# Altium schematic sheet SIM.SchDoc
size A4; SheetNumber: 4; SheetTotal: 5
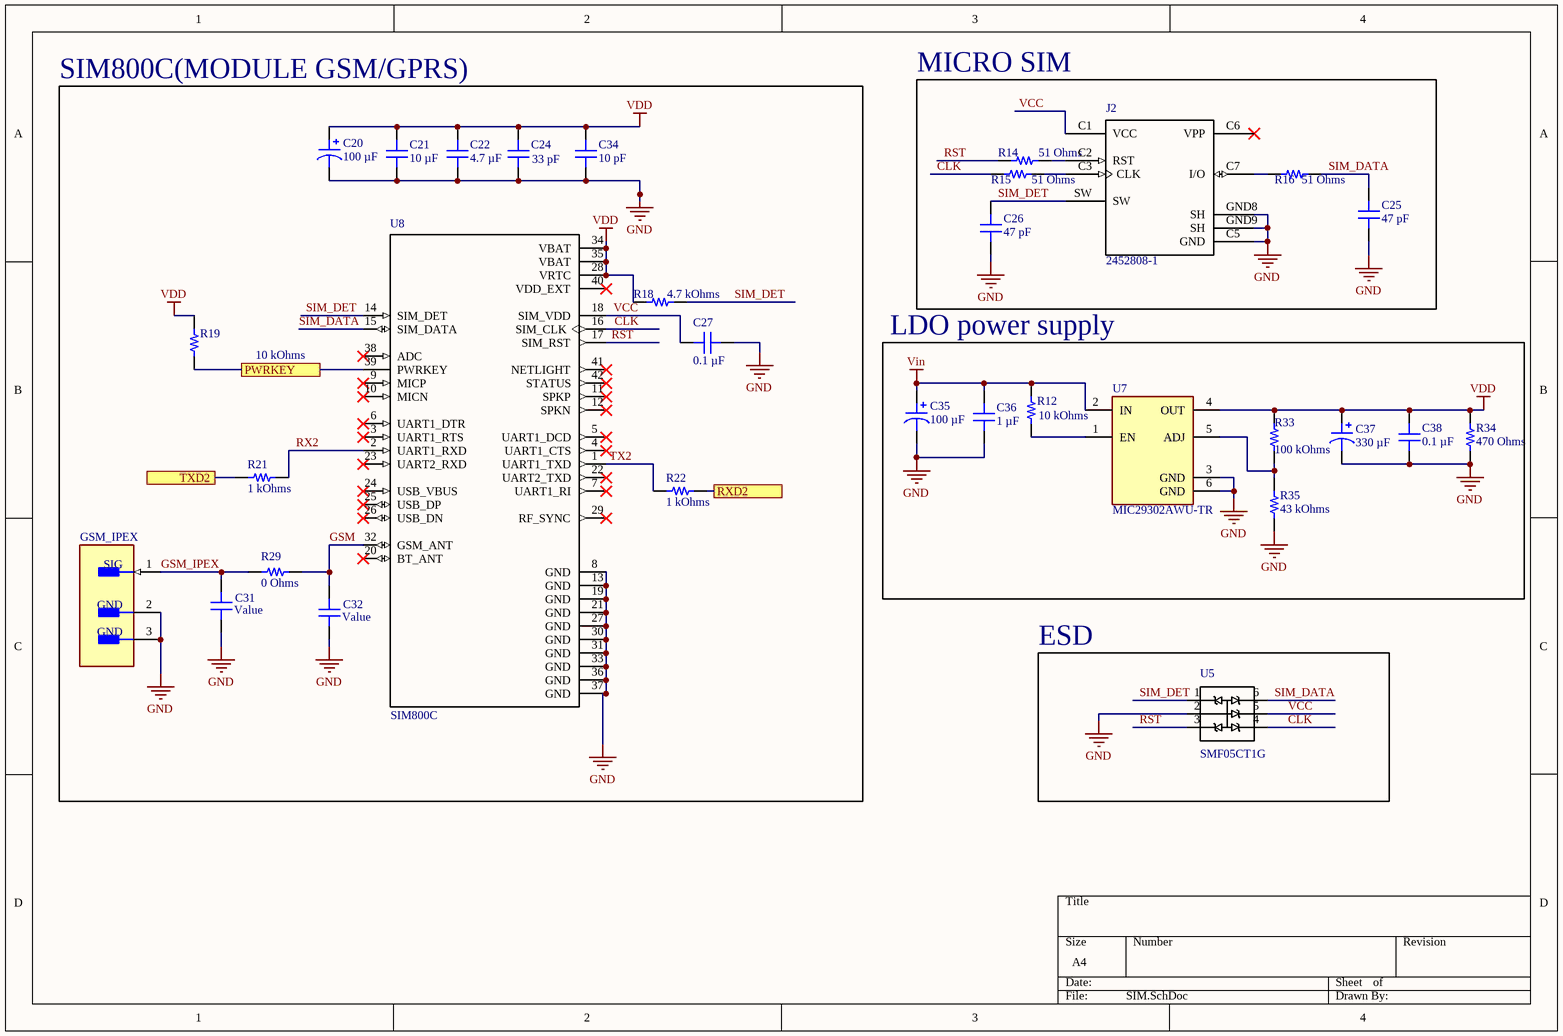
[diagram p0: SIM.SchDoc]

## Parts
C20  100 µF  [CAP POL 1206_3216]
C21  10 µF  [CAP 0805_2012]
C22  4.7 µF  [CAP 0402_1005]
C24  Capacitance: 33 pF  [CAP 0402_1005]  (hidden comment: Value)
C25  47 pF  [CAP 0402_1005]
C26  47 pF  [CAP 0402_1005]
C27  0.1 µF  [CAP 0402_1005]
C31  Value  [CAP 0402_1005]
C32  Value  [CAP 0402_1005]
C34  10 pF  [CAP 0402_1005]
C35  100 µF  [CAP POL 1206_3216]
C36  1 µF  [CAP 0402_1005]
C37  330 µF  [CAP POL 2917_7343]
C38  0.1 µF  [CAP 0402_1005]
GSM_IPEX  U.FL-R-SMT-1(10)  [FP-U_FL-R-SMT-1_10-MFG]  (value not drawn)
J2  2452808-1  [*TE_2452808-1_2452808-1(Primary)]
R12  10 kOhms  [RES 0402_1005]
R14  51 Ohms  [RES 0402_1005]
R15  51 Ohms  [RES 0402_1005]
R16  51 Ohms  [RES 0402_1005]
R18  4.7 kOhms  [RES 0402_1005]
R19  10 kOhms  [RES 0402_1005]
R21  1 kOhms  [RES 0402_1005]
R22  1 kOhms  [RES 0402_1005]
R29  0 Ohms  [RES 0402_1005]
R33  100 kOhms  [RES 0402_1005]
R34  470 Ohms  [RES 0402_1005]
R35  43 kOhms  [RES 0402_1005]
U5  SMF05CT1G  [*SOT65P210X110-6N]
U7  MIC29302AWU-TR  [FP-T0263-5LD-PL-1-MFG]
U8  SIM800C  [SIM800C]

## Blocks framed on the sheet
SIM800C(MODULE GSM/GPRS): C20-C22 C24 C27 C31 C32 C34 GSM_IPEX R18 R19 R21 R22 R29 U8
MICRO SIM: C25 C26 J2 R14-R16
LDO power supply: C35-C38 R12 R33-R35 U7
ESD: U5

## Ports
PWRKEY, RXD2, TXD2

## Nets
GND: C20.2 C21.1 C22.1 C24.1 C25.1 C26.1 C27.1 C31.1 C32.1 C34.1 C35.2 C36.1 C37.2 C38.1 GSM_IPEX.2(GND) GSM_IPEX.3(GND) J2.C5(GND) J2.GND8(SH) J2.GND9(SH) R34.1 R35.1 U5.2(A) U7.3(GND) U7.6(GND) U8.8(GND) U8.13(GND) U8.19(GND) U8.21(GND) U8.27(GND) U8.30(GND) U8.31(GND) U8.33(GND) U8.36(GND) U8.37(GND)
VDD: C20.1 C21.2 C22.2 C24.2 C34.2 C37.1 C38.2 R18.1 R19.2 R33.2 R34.2 U7.4(OUT) U8.28(VRTC) U8.34(VBAT) U8.35(VBAT)
Vin: C35.1 C36.2 R12.2 U7.2(IN)
CLK: R15.1 U5.4(C3) U8.16(SIM_CLK)
GSM: C32.2 R29.2 U8.32(GSM_ANT)
GSM_IPEX: C31.2 GSM_IPEX.1(SIG) R29.1
PWRKEY: R19.1 U8.39(PWRKEY) ; port PWRKEY
RST: R14.1 U5.3(C2) U8.17(SIM_RST)
RX2: R21.1 U8.2(UART1_RXD)
RXD2: R22.1 ; port RXD2
SIM_DATA: C25.2 R16.2 U5.6(C5) U8.15(SIM_DATA)
SIM_DET: C26.2 J2.SW R18.2 U5.1(C1) U8.14(SIM_DET)
TX2: R22.2 U8.1(UART1_TXD)
TXD2: R21.2 ; port TXD2
VCC: C27.2 J2.C1(VCC) U5.5(C4) U8.18(SIM_VDD)
NetJ2_C2: J2.C2(RST) R14.2
NetJ2_C3: J2.C3(CLK) R15.2
NetJ2_C7: J2.C7(I/O) R16.1
NetR12_1: R12.1 U7.1(EN)
NetR33_1: R33.1 R35.2 U7.5(ADJ)

Not connected (* = marked no-connect by the designer): J2 C6(VPP)*; U8 3(UART1_RTS)* 4(UART1_CTS)* 5(UART1_DCD)* 6(UART1_DTR)* 7(UART1_RI)* 9(MICP)* 10(MICN)* 11(SPKP)* 12(SPKN)* 20(BT_ANT)* 22(UART2_TXD)* 23(UART2_RXD)* 24(USB_VBUS)* 25(USB_DP)* 26(USB_DN)* 29(RF_SYNC)* 38(ADC)* 40(VDD_EXT)* 41(NETLIGHT)* 42(STATUS)*

## Library data of the parts
C20 C35 = T490A107M004ATE500: CAP TANT 100UF 20% 4V 1206; manufacturer: KEMET; Manufacturer Size Code: A; ESR (Equivalent Series Resistance): 500mOhm; Lifetime @ Temp.: 1000 Hrs @ 85°C; Type: Molded; Part Number: T490A107M004ATE500; Value: 100 µF; Capacitance: 100 µF; componentlink1description: Datasheet; componentlink1url: https://api.kemet.com/component-edge/download/specsheet/T490A107M004ATE500.pdf; componentlink2description: DigiKey Link; componentlink2url: https://www.digikey.com/en/products/detail/kemet/T490A107M004ATE500/5267624; Device Package: 1206 (3216 Metric); Features: General Purpose; Height - Seated (Max): 0.071" (1.80mm); lastupdated: 05/04/2026 8:12:52 PM; Lifecycle Status: Active; Minimum Order: 1; Mounting Type: Surface Mount; Operating Temperature: -55°C ~ 125°C; Package / Case: 1206 (3216 Metric); packaging: TapeAndReel; partid: 312; Part Status: Active; price: 0.29; series: T490; Size / Dimension: 0.126" L x 0.063" W (3.20mm x 1.60mm); Supplier 1: DigiKey; Supplier Part Number 1: 399-11974-1-ND; Tolerance: ±20%; Voltage - Rated: 4 V
C21 = GMC21X7S106K6R3NT: CAP0805 X7S 10UF 10% 6.3V; manufacturer: Cal-Chip Electronics, Inc.; Part Number: GMC21X7S106K6R3NT; Capacitance: 10 µF; Applications: General Purpose; componentlink1description: Datasheet; componentlink1url: https://calchip.com/wp-content/uploads/2024/02/gmc_series-1.pdf; componentlink2description: DigiKey Link; componentlink2url: https://www.digikey.com/en/products/detail/cal-chip-electronics-inc/GMC21X7S106K6R3NT/25820663; Device Package: 0805 (2012 Metric); lastupdated: 06/04/2026 7:28:46 PM; Lifecycle Status: Active; Minimum Order: 1; Mounting Type: Surface Mount, MLCC; Operating Temperature: -55°C ~ 125°C; Package / Case: 0805 (2012 Metric); packaging: TapeAndReel; partid: 69922; price: 0.08; series: GMC; Size / Dimension: 0.079" L x 0.049" W (2.00mm x 1.25mm); Supplier 1: DigiKey; Supplier Part Number 1: 4713-GMC21X7S106K6R3NTCT-ND; Temperature Coefficient: X7S; Thickness (Max): 0.057" (1.45mm); Tolerance: ±10%; value: 10 µF; Voltage - Rated: 6.3V
C22 = KAM05CT70J475KH: 0402 6.3 V X7T 4.7UF 10%; manufacturer: KYOCERA AVX; Voltage - Rated: 6.3V; Part Number: KAM05CT70J475KH; Capacitance: 4.7 µF; Applications: Automotive; componentlink1description: Datasheet; componentlink1url: https://media.digikey.com/pdf/Data%20Sheets/AVX%20PDFs/KAM05CT70J475KH.pdf; componentlink2description: DigiKey Link; componentlink2url: https://www.digikey.com/en/products/detail/kyocera-avx/KAM05CT70J475KH/18685863; Device Package: 0402 (1005 Metric); lastupdated: 06/04/2026 7:09:20 PM; Lifecycle Status: Active; Minimum Order: 1; Mounting Type: Surface Mount, MLCC; Operating Temperature: -55°C ~ 125°C; Package / Case: 0402 (1005 Metric); packaging: TapeAndReel; partid: 50105; Part Status: Active; price: 0.05; Ratings: AEC-Q200; series: -; Size / Dimension: 0.039" L x 0.020" W (1.00mm x 0.50mm); Supplier 1: DigiKey; Supplier Part Number 1: 478-KAM05CT70J475KHCT-ND; Temperature Coefficient: X7T; Thickness (Max): 0.028" (0.70mm); Tolerance: ±10%; value: 4.7 µF
C24 = GMC04CG330F50NT: CAP0402 COG 33PF 1% 50V; Part Number: GMC04CG330F50NT
C25 C26 = GMC04CG470F50NT: CAP0402 COG 47PF 1% 50V; manufacturer: Cal-Chip Electronics, Inc.; Temperature Coefficient: C0G, NP0; Part Number: GMC04CG470F50NT; Capacitance: 47 pF; Applications: General Purpose; componentlink1description: Datasheet; componentlink1url: https://calchip.com/wp-content/uploads/2024/02/gmc_series-1.pdf; componentlink2description: DigiKey Link; componentlink2url: https://www.digikey.com/en/products/detail/cal-chip-electronics-inc/GMC04CG470F50NT/22620477; Device Package: 0402 (1005 Metric); lastupdated: 06/04/2026 7:07:18 PM; Lifecycle Status: Active; Minimum Order: 1; Mounting Type: Surface Mount, MLCC; Operating Temperature: -55°C ~ 125°C; Package / Case: 0402 (1005 Metric); packaging: TapeAndReel; partid: 63346; price: 0.01; series: GMC; Size / Dimension: 0.039" L x 0.020" W (1.00mm x 0.50mm); Supplier 1: DigiKey; Supplier Part Number 1: 4713-GMC04CG470F50NTCT-ND; Thickness (Max): 0.022" (0.55mm); Tolerance: ±1%; value: 47 pF; Voltage - Rated: 50V
C27 C38 = 885012105001: CAP CER 0.1UF 6.3V X5R 0402; manufacturer: Würth Elektronik; Tolerance: ±20%; Part Number: 885012105001; Capacitance: 0.1 µF; Applications: General Purpose; componentlink1description: Datasheet; componentlink1url: https://katalog.we-online.de/pbs/datasheet/885012105001.pdf; componentlink2description: DigiKey Link; componentlink2url: https://www.digikey.com/en/products/detail/würth-elektronik/885012105001/5453333; Device Package: 0402 (1005 Metric); lastupdated: 06/04/2026 7:11:10 PM; Lifecycle Status: Active; Minimum Order: 1; Mounting Type: Surface Mount, MLCC; Operating Temperature: -55°C ~ 85°C; Package / Case: 0402 (1005 Metric); packaging: TapeAndReel; partid: 1931; Part Status: Active; price: 0.01; series: WCAP-CSGP; Size / Dimension: 0.039" L x 0.020" W (1.00mm x 0.50mm); Supplier 1: DigiKey; Supplier Part Number 1: 732-7478-1-ND; Temperature Coefficient: X5R; Thickness (Max): 0.022" (0.55mm); value: 0.1 µF; Voltage - Rated: 6.3V
C31 C32 = NMC0402X5R105K6.3TRPF: CAP SMT04021F6.3VDC; Capacitance: 1 µF; Part Number: NMC0402X5R105K6.3TRPF
C34 = GMC04CG100F16NT: CAP0402 COG 10PF 1% 16V; manufacturer: Cal-Chip Electronics, Inc.; Temperature Coefficient: C0G, NP0; Part Number: GMC04CG100F16NT; Capacitance: 10 pF; Applications: General Purpose; componentlink1description: Datasheet; componentlink1url: https://calchip.com/wp-content/uploads/2025/05/GMC-Series-3.pdf; componentlink2description: DigiKey Link; componentlink2url: https://www.digikey.com/en/products/detail/cal-chip-electronics-inc/GMC04CG100F16NT/27783264; Device Package: 0402 (1005 Metric); Features: General Purpose; lastupdated: 06/04/2026 7:06:51 PM; Lifecycle Status: Active; Minimum Order: 1; Mounting Type: Surface Mount, MLCC; Operating Temperature: -55°C ~ 125°C; Package / Case: 0402 (1005 Metric); packaging: TapeAndReel; partid: 61390; price: 0.03; series: GMC; Size / Dimension: 0.039" L x 0.020" W (1.00mm x 0.50mm); Supplier 1: DigiKey; Supplier Part Number 1: 4713-GMC04CG100F16NTCT-ND; Thickness (Max): 0.022" (0.55mm); Tolerance: ±1%; value: 10 pF; Voltage - Rated: 16V
C36 = 0402DD105KAT2A: 0402 X5R 1UF10% 35V; manufacturer: KYOCERA AVX; Tolerance: ±10%; Part Number: 0402DD105KAT2A; Capacitance: 1 µF; Applications: General Purpose; componentlink1description: Datasheet; componentlink1url: https://datasheets.kyocera-avx.com/cx5r.pdf; componentlink2description: DigiKey Link; componentlink2url: https://www.digikey.com/en/products/detail/kyocera-avx/0402DD105KAT2A/17866333; Device Package: 0402 (1005 Metric); lastupdated: 06/04/2026 7:08:54 PM; Lifecycle Status: Active; Minimum Order: 1; Mounting Type: Surface Mount, MLCC; Operating Temperature: -55°C ~ 85°C; Package / Case: 0402 (1005 Metric); packaging: TapeAndReel; partid: 52378; Part Status: Active; price: 0.02; series: -; Size / Dimension: 0.039" L x 0.020" W (1.00mm x 0.50mm); Supplier 1: DigiKey; Supplier Part Number 1: 478-0402DD105KAT2ACT-ND; Temperature Coefficient: X5R; value: 1 µF; Voltage - Rated: 35V
C37 = TCME337M016R0025E: 330UF (MICRO FARAD)25MOHM @ 100K; manufacturer: KYOCERA AVX; Manufacturer Size Code: E; ESR (Equivalent Series Resistance): 25mOhm @ 100kHz; Lifetime @ Temp.: 2000 Hrs @ 125°C; Tolerance: ±20%; Type: Molded; Voltage - Rated: 16 V; Part Number: TCME337M016R0025E; Value: 330 µF; Capacitance: 330 µF; componentlink1description: Datasheet; componentlink1url: https://datasheets.kyocera-avx.com/TCM.pdf; componentlink2description: DigiKey Link; componentlink2url: https://www.digikey.com/en/products/detail/kyocera-avx/TCME337M016R0025E/17868563; Device Package: 2917 (7343 Metric); Features: General Purpose; Height - Seated (Max): 0.169" (4.30mm); lastupdated: 05/04/2026 8:18:12 PM; Lifecycle Status: Active; Minimum Order: 1; Mounting Type: Surface Mount; Operating Temperature: -55°C ~ 125°C; Package / Case: 2917 (7343 Metric); packaging: TapeAndReel; partid: 6640; price: 2.44; series: TCM; Size / Dimension: 0.287" L x 0.169" W (7.30mm x 4.30mm); Supplier 1: DigiKey; Supplier Part Number 1: 478-TCME337M016R0025ECT-ND
GSM_IPEX = CMP-2000-05152-3: CONN U.FL RCPT STR 50 OHM SMD; Max Frequency: 6GHz; Connector Type: Coaxial; Body Plating: Silver; Body Material: Bronze; Impedance: 50R; Dielectric Material: Polymer; Insulation Resistance: 500MR; Gender: Male; Packaging: Cut Tape; Length: 3mm; Package Quantity: 2500; Termination: Solder; Lead Free: Lead Free; Series: U.FL; Min Operating Temperature: -40°C; Fastening Type: Snap; Contact Material: Brass; Orientation: Straight; Wire/Cable Type: Coaxial; Frequency: 6GHz; Contact Plating: Gold; Depth: 3.1mm; Weight: 0.001764oz; Max Operating Temperature: 90°C; Radiation Hardening: No; REACH SVHC: No SVHC; Mount: Surface Mount; Housing Color: Beige
J2 = 2452808-1: 8 (6 + 2) Position Card Connector NANO SIM Surface Mount, Right Angle Gold; MF: TE Connectivity; Package: None; Price: None; SnapEDA_Link: https://www.snapeda.com/parts/2452808-1/TE+Connectivity/view-part/?ref=snap; MP: 2452808-1; Availability: In Stock; Check_prices: https://www.snapeda.com/parts/2452808-1/TE+Connectivity/view-part/?ref=eda; Value: *
R12 R19 = TNPU040210K0BZEP00: TNPU0402 10K 0.1% T-16 EP1 E3; Manufacturer: Vishay Dale; Power (Watts): 0.063W, 1/16W; Temperature Coefficient: ±5ppm/°C; Part Number: TNPU040210K0BZEP00; Value: 10 kOhms; ComponentLink1Description: Datasheet; ComponentLink1URL: http://www.vishay.com/docs/28779/tnpue3.pdf; ComponentLink2Description: DigiKey Link; ComponentLink2URL: https://www.digikey.com/en/products/detail/vishay-dale/TNPU040210K0BZEP00/10668512; Composition: Thin Film; Device Package: 0402 (1005 Metric); Features: Anti-Sulfur, Automotive AEC-Q200, Moisture Resistant; Height - Seated (Max): 0.016" (0.40mm); LastUpdated: 09/02/2024 8:29:39 PM; Lifecycle Status: Active; Minimum Order: 1; Number of Terminations: 2; Operating Temperature: -55°C ~ 125°C; Package / Case: 0402 (1005 Metric); Packaging: TapeAndReel; PartId: 49938; Part Status: Active; Price: 0.67; Ratings: AEC-Q200; Resistance: 10 kOhms; Series: TNPU e3; Size / Dimension: 0.039" L x 0.020" W (1.00mm x 0.50mm); Supplier 1: DigiKey; Supplier Part Number 1: 541-TNPU040210K0BZEP00CT-ND; Supplier Device Package: 0402; Tolerance: ±0.1%
R14-R16 = CR0402-JW-510GLF: RES SMD 51 OHM 5% 1/16W 0402; Manufacturer: Bourns Inc.; Power (Watts): 0.063W, 1/16W; Temperature Coefficient: ±200ppm/°C; Part Number: CR0402-JW-510GLF; Value: 51 Ohms; ComponentLink1Description: Datasheet; ComponentLink1URL: https://www.bourns.com/docs/Product-Datasheets/CR0402.pdf; ComponentLink2Description: DigiKey Link; ComponentLink2URL: https://www.digikey.com/en/products/detail/bourns-inc/CR0402-JW-510GLF/3783623; Composition: Thick Film; Device Package: 0402 (1005 Metric); Height - Seated (Max): 0.016" (0.40mm); LastUpdated: 09/02/2024 8:29:49 PM; Lifecycle Status: Active; Minimum Order: 1; Number of Terminations: 2; Operating Temperature: -55°C ~ 155°C; Package / Case: 0402 (1005 Metric); Packaging: CutTape; PartId: 12185; Part Status: Active; Price: 0.01; Resistance: 51 Ohms; Series: CR0402; Size / Dimension: 0.039" L x 0.020" W (1.00mm x 0.50mm); Supplier 1: DigiKey; Supplier Part Number 1: CR0402-JW-510GLFCT-ND; Supplier Device Package: 0402; Tolerance: ±5%
R18 = NT0402BRD074K7L: RES THIN FILM 0.10% 1/20W 4.7K; Manufacturer: Yageo; Power (Watts): 0.05W, 1/20W; Temperature Coefficient: ±25ppm/°C; Tolerance: ±0.1%; Part Number: NT0402BRD074K7L; Value: 4.7 kOhms; ComponentLink1Description: Datasheet; ComponentLink1URL: https://www.yageo.com/upload/media/product/productsearch/datasheet/rchip/PYu-NT_51_RoHS_L_0.pdf; ComponentLink2Description: DigiKey Link; ComponentLink2URL: https://www.digikey.com/en/products/detail/yageo/NT0402BRD074K7L/22206010; Composition: Thin Film; Device Package: 0402 (1005 Metric); Features: Anti-Sulfur, Automotive AEC-Q200; Height - Seated (Max): 0.014" (0.35mm); LastUpdated: 06/04/2026 7:40:36 PM; Lifecycle Status: Active; Minimum Order: 1; Number of Terminations: 2; Operating Temperature: -55°C ~ 155°C; Package / Case: 0402 (1005 Metric); Packaging: TapeAndReel; PartId: 85342; Price: 0.17; Ratings: AEC-Q200; Resistance: 4.7 kOhms; Series: NT; Size / Dimension: 0.039" L x 0.020" W (1.00mm x 0.50mm); Supplier 1: DigiKey; Supplier Part Number 1: 13-NT0402BRD074K7LCT-ND; Supplier Device Package: 0402
R21 R22 = TNPU04021K00BZEP00: TNPU0402 1K0 0.1% T-16 EP1 E3; Manufacturer: Vishay Dale; Power (Watts): 0.063W, 1/16W; Temperature Coefficient: ±5ppm/°C; Part Number: TNPU04021K00BZEP00; Value: 1 kOhms; ComponentLink1Description: Datasheet; ComponentLink1URL: http://www.vishay.com/docs/28779/tnpue3.pdf; ComponentLink2Description: DigiKey Link; ComponentLink2URL: https://www.digikey.com/en/products/detail/vishay-dale/TNPU04021K00BZEP00/10668523; Composition: Thin Film; Device Package: 0402 (1005 Metric); Features: Anti-Sulfur, Automotive AEC-Q200, Moisture Resistant; Height - Seated (Max): 0.016" (0.40mm); LastUpdated: 09/02/2024 8:29:39 PM; Lifecycle Status: Active; Minimum Order: 1; Number of Terminations: 2; Operating Temperature: -55°C ~ 125°C; Package / Case: 0402 (1005 Metric); Packaging: TapeAndReel; PartId: 49940; Part Status: Active; Price: 0.67; Ratings: AEC-Q200; Resistance: 1 kOhms; Series: TNPU e3; Size / Dimension: 0.039" L x 0.020" W (1.00mm x 0.50mm); Supplier 1: DigiKey; Supplier Part Number 1: 541-TNPU04021K00BZEP00CT-ND; Supplier Device Package: 0402; Tolerance: ±0.1%
R29 = CR0402AJ/-000GAS: RESA-AS 0402 0R JUMPER 63MW; Part Number: CR0402AJ/-000GAS; Value: 0 Ohms
R33 = TNPU0402100KBZEP00: TNPU0402 100K 0.1% T-16 EP1 E3; Manufacturer: Vishay Dale; Power (Watts): 0.063W, 1/16W; Temperature Coefficient: ±5ppm/°C; Part Number: TNPU0402100KBZEP00; Value: 100 kOhms; ComponentLink1Description: Datasheet; ComponentLink1URL: http://www.vishay.com/docs/28779/tnpue3.pdf; ComponentLink2Description: DigiKey Link; ComponentLink2URL: https://www.digikey.com/en/products/detail/vishay-dale/TNPU0402100KBZEP00/10668520; Composition: Thin Film; Device Package: 0402 (1005 Metric); Features: Anti-Sulfur, Automotive AEC-Q200, Moisture Resistant; Height - Seated (Max): 0.016" (0.40mm); LastUpdated: 09/02/2024 8:29:39 PM; Lifecycle Status: Active; Minimum Order: 1; Number of Terminations: 2; Operating Temperature: -55°C ~ 125°C; Package / Case: 0402 (1005 Metric); Packaging: TapeAndReel; PartId: 49945; Part Status: Active; Price: 0.67; Ratings: AEC-Q200; Resistance: 100 kOhms; Series: TNPU e3; Size / Dimension: 0.039" L x 0.020" W (1.00mm x 0.50mm); Supplier 1: DigiKey; Supplier Part Number 1: 541-TNPU0402100KBZEP00CT-ND; Supplier Device Package: 0402; Tolerance: ±0.1%
R34 = CR0402-JW-471GLF: RES SMD 470 OHM 5% 1/16W 0402; Manufacturer: Bourns Inc.; Power (Watts): 0.063W, 1/16W; Temperature Coefficient: ±200ppm/°C; Part Number: CR0402-JW-471GLF; Value: 470 Ohms; ComponentLink1Description: Datasheet; ComponentLink1URL: https://www.bourns.com/docs/Product-Datasheets/CR0402.pdf; ComponentLink2Description: DigiKey Link; ComponentLink2URL: https://www.digikey.com/en/products/detail/bourns-inc/CR0402-JW-471GLF/3783619; Composition: Thick Film; Device Package: 0402 (1005 Metric); Height - Seated (Max): 0.016" (0.40mm); LastUpdated: 09/02/2024 8:29:41 PM; Lifecycle Status: Active; Minimum Order: 1; Number of Terminations: 2; Operating Temperature: -55°C ~ 155°C; Package / Case: 0402 (1005 Metric); Packaging: CutTape; PartId: 15140; Part Status: Active; Price: 0.01; Resistance: 470 Ohms; Series: CR0402; Size / Dimension: 0.039" L x 0.020" W (1.00mm x 0.50mm); Supplier 1: DigiKey; Supplier Part Number 1: CR0402-JW-471GLFCT-ND; Supplier Device Package: 0402; Tolerance: ±5%
R35 = TNPW040243K0BYEP: TNPW0402 43K 0.1% T-13 EP1 E3; Manufacturer: Vishay Dale; Power (Watts): 0.063W, 1/16W; Temperature Coefficient: ±10ppm/°C; Part Number: TNPW040243K0BYEP; Value: 43 kOhms; ComponentLink1Description: Datasheet; ComponentLink1URL: https://www.vishay.com/docs/28758/tnpw_e3.pdf; ComponentLink2Description: DigiKey Link; ComponentLink2URL: https://www.digikey.com/en/products/detail/vishay-dale/TNPW040243K0BYEP/18881081; Composition: Thin Film; Device Package: 0402 (1005 Metric); Features: Anti-Sulfur, Automotive AEC-Q200, Moisture Resistant; Height - Seated (Max): 0.016" (0.40mm); LastUpdated: 09/02/2024 8:28:21 PM; Lifecycle Status: Active; Minimum Order: 1; Number of Terminations: 2; Operating Temperature: -55°C ~ 155°C; Package / Case: 0402 (1005 Metric); Packaging: TapeAndReel; PartId: 84048; Price: 0.25; Ratings: AEC-Q200; Resistance: 43 kOhms; Series: TNPW e3; Size / Dimension: 0.039" L x 0.020" W (1.00mm x 0.50mm); Supplier 1: DigiKey; Supplier Part Number 1: 541-TNPW040243K0BYEPCT-ND; Supplier Device Package: 0402; Tolerance: ±0.1%
U5 = SMF05CT1G: 12.5V Clamp 8A (8/20Âµs) Ipp Tvs Diode Surface Mount SC-88/SC70-6/SOT-363; MF: onsemi; Package: SC-88-6 ON Semiconductor; Price: None; Check_prices: https://www.snapeda.com/parts/SMF05CT1G/Onsemi/view-part/?ref=eda; SnapEDA_Link: https://www.snapeda.com/parts/SMF05CT1G/Onsemi/view-part/?ref=snap; MP: SMF05CT1G; Availability: In Stock; Purchase-URL: https://www.snapeda.com/api/url_track_click_mouser/?unipart_id=7109045&manufacturer=onsemi&part_name=SMF05CT1G&search_term= smf05ct1g; Value: *
U7 = CMP-06324-000015-1: IC REG LINEAR POS ADJ 3A TO263-5; Manufacturer: Microchip Technology; Max Junction Temp: +125°C; Dropout Voltage: 560mV; Standoff Height: 0mm; Output Type: AdjustableProgrammable; Accuracy Percentage: 2%; Output Voltage: 1.24-15V; Min Supply Voltage: 3V; Max Supply Voltage: 16V; Number Of Outputs: 1; Nominal Supply Current: 5-60mA; Lead Free: Yes; Automotive: No; Manufacturer Part Number: MIC29302AWU-TR; Octopart: https://octopart.com/mic29302awu-tr-microchip-66801317; ComponentLink2Description: Datasheet; Device Class L1: Integrated Circuits (ICs); Device Class L2: Power Management ICs; Category: IC; Temperature: -40°C to +125°C; Package: T0263-5LD-PL-1; Height: 4.902mm; Temperature Range High: +125°C; Mouser Description: LDO Voltage Regulators 3A Fast-Response LDO; Temperature Range Low: -40°C; ComponentLink2URL: http://ww1.microchip.com/downloads/en/DeviceDoc/20005897B.pdf; RoHS: TRUE; Device Class L3: Voltage Regulators - Linear; Output Current: 3A; Digikey Description: IC REG LINEAR POS ADJ 3A TO263-5
U8 = SIM800C: Module: GSM/Bluetooth; GPRS; 2G; 1800MHz, 900MHz; 85.6kbps; SMD; MF: Simcom; Package: None; Price: None; SnapEDA_Link: https://www.snapeda.com/parts/SIM800C/SIMCom/view-part/?ref=snap; MP: SIM800C; Availability: In Stock; Check_prices: https://www.snapeda.com/parts/SIM800C/SIMCom/view-part/?ref=eda; Value: *